# Altium project Fio4.PrjPcb
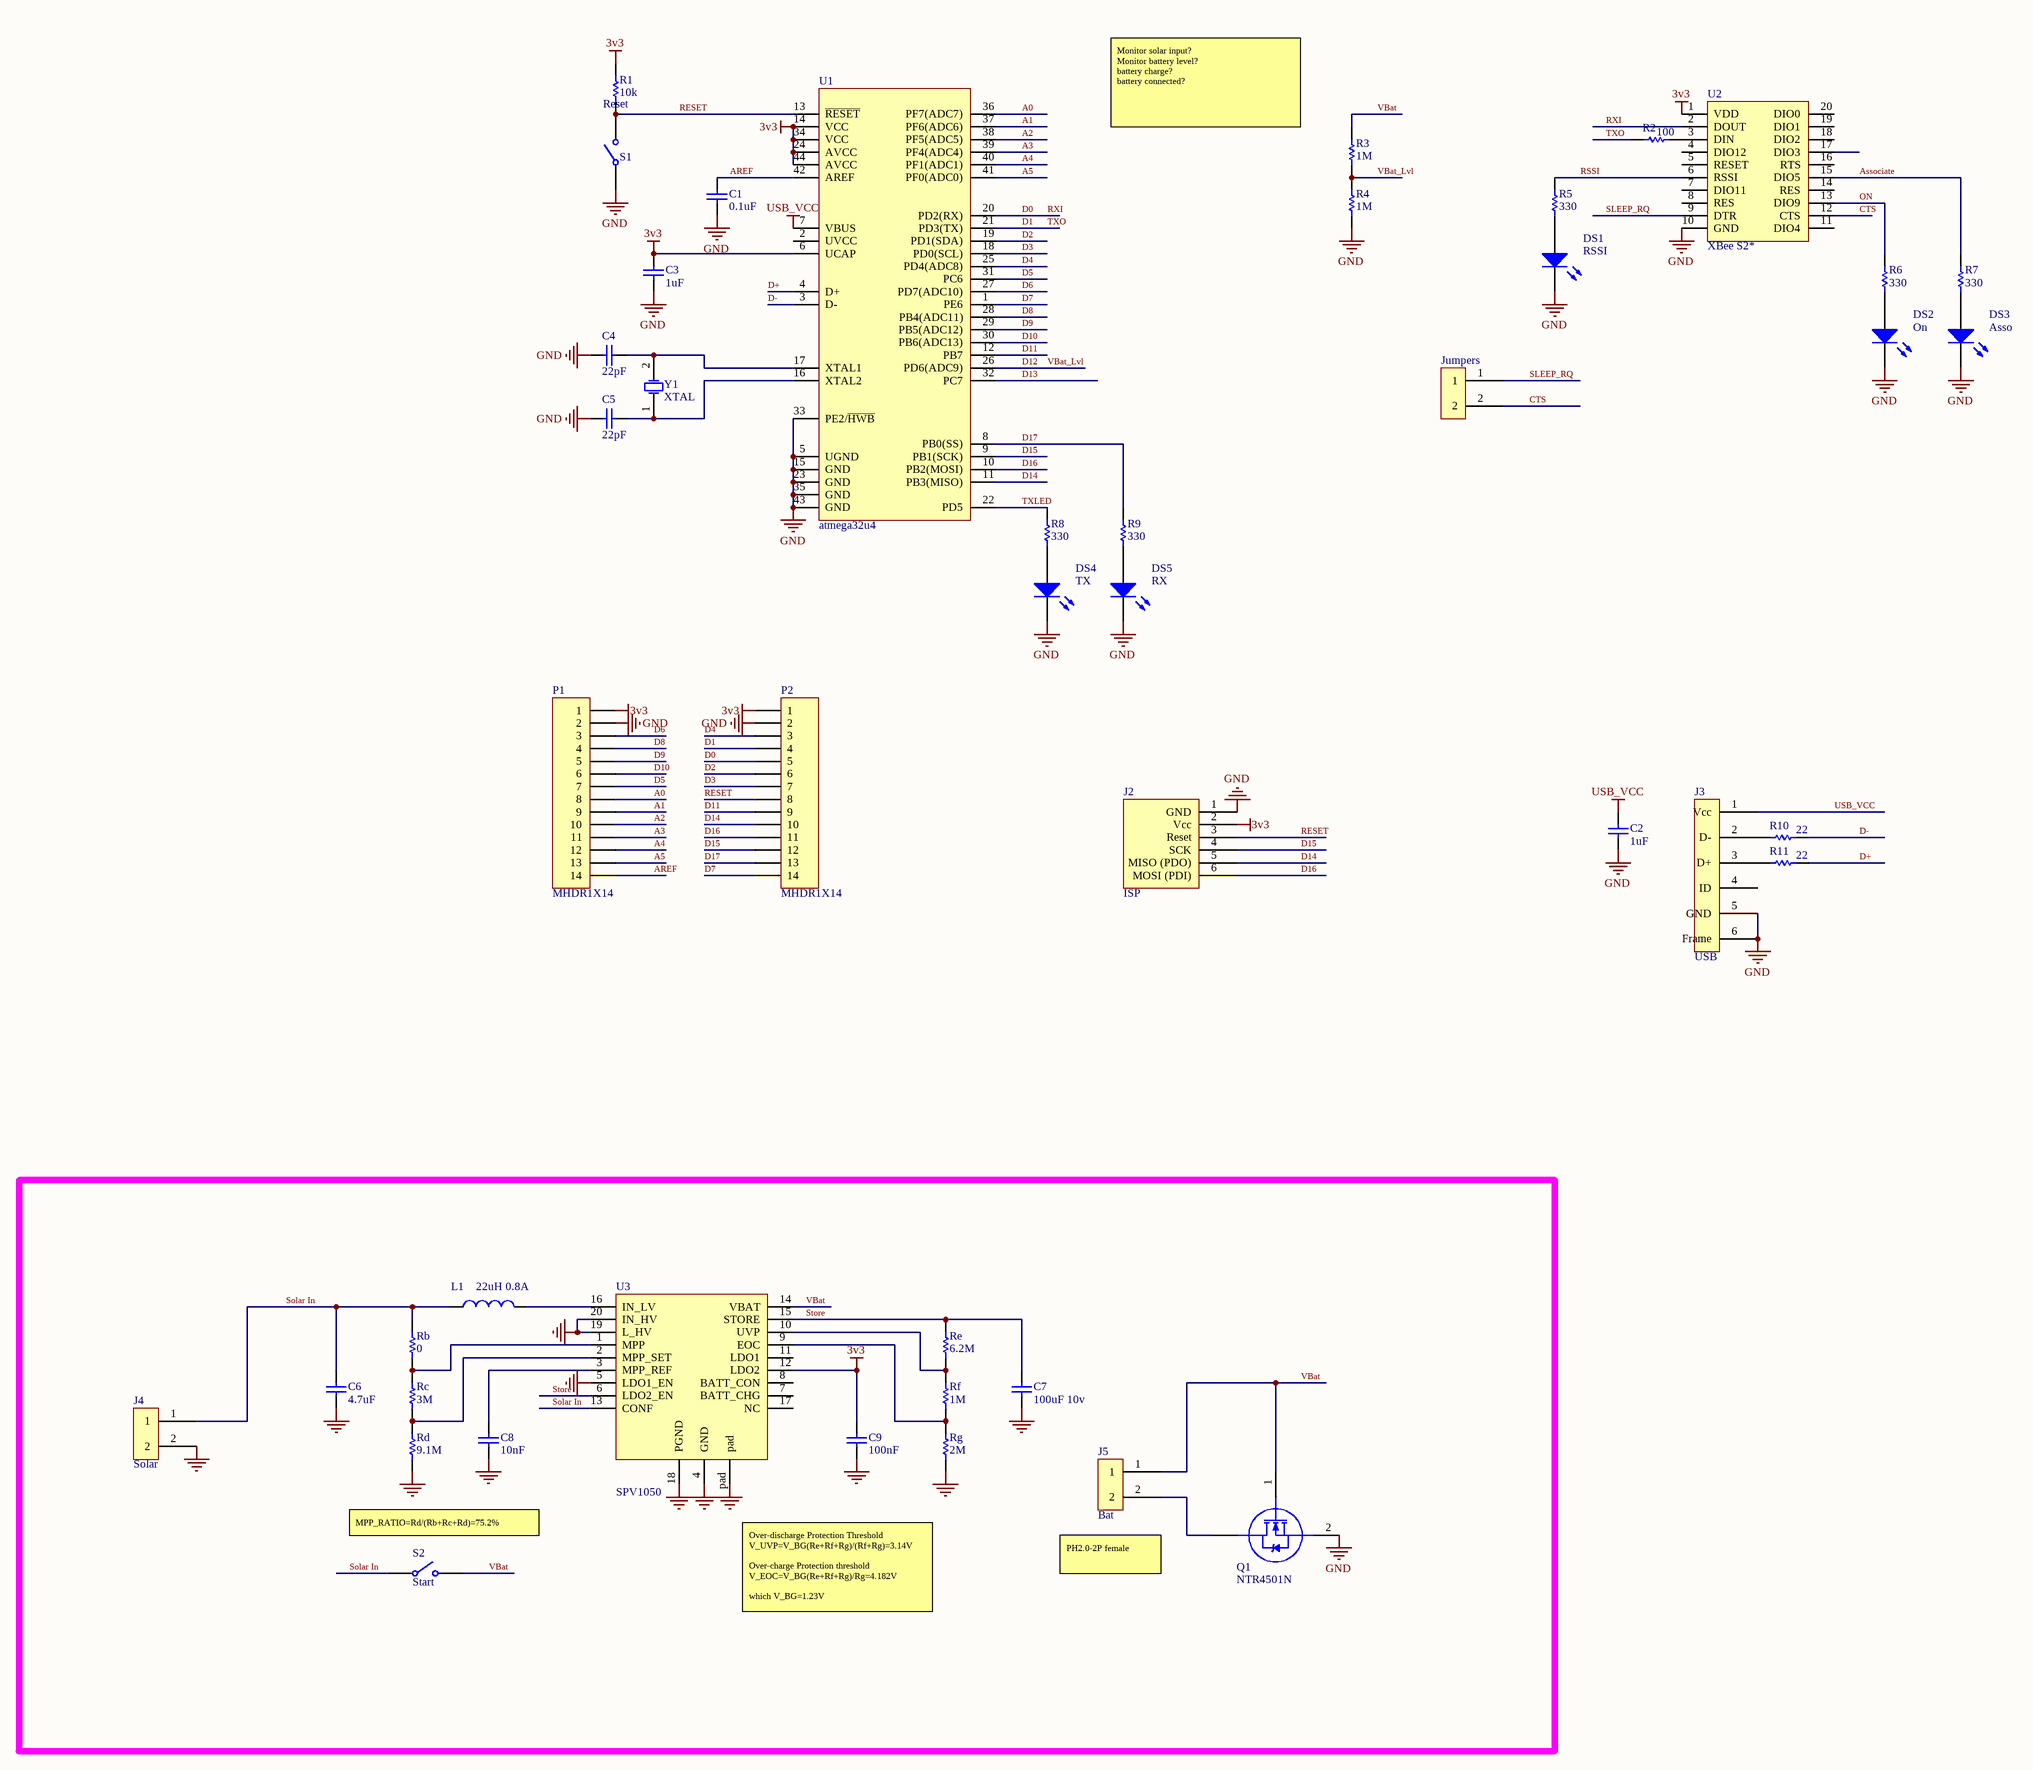
[diagram p0: Fio4.SchDoc]
1 sheet, 46 parts. Net scope: global (net labels, ports and power ports of the same name join across sheets).

## Sheet Fio4.SchDoc
size A1

### Parts
C1  value 0.1uF  [Cap SMD 0603]  (hidden comment: Cap)
C2  value 1uF  [Cap SMD 0805A]  (hidden comment: Cap)
C3  value 1uF  [Cap SMD 0603]  (hidden comment: Cap)
C4  value 22pF  [Cap SMD 0603]  (hidden comment: Cap)
C5  value 22pF  [Cap SMD 0603]  (hidden comment: Cap)
C6  value 4.7uF  [Cap SMD 0805A]  (hidden comment: Cap)
C7  value 100uF 10v  [Cap SMD 0805A]  (hidden comment: Cap)
C8  value 10nF  [Cap SMD 0603]  (hidden comment: Cap)
C9  value 100nF  [Cap SMD 0603]  (hidden comment: Cap)
DS1  RSSI  [LED SMD 0603]
DS2  On  [LED SMD 0603]
DS3  Asso  [LED SMD 0603]
DS4  TX  [LED SMD 0603]
DS5  RX  [LED SMD 0603]
J2  ISP  [HDR2x3]
J3  USB  [USB mini]
J4  Solar  [0.1 SIP 2 PIN]
J5  Bat  [0.1 SIP 2 PIN]
Jumpers  SIP2 CONNECTOR  [HDR2]  (value not drawn)
L1  value 22uH 0.8A  [Inductor SMD CoilCraft LPS4018]  (hidden comment: Inductor)
P1  MHDR1X14  [HDR14]
P2  MHDR1X14  [HDR14]
Q1  NTR4501N  [SO-G3]
R1  value 10k  [Res SMD 0603]  (hidden comment: Res1)
R2  value 100  [Res SMD 0603]  (hidden comment: Res1)
R3  value 1M  [Res SMD 0603]  (hidden comment: Res1)
R4  value 1M  [Res SMD 0603]  (hidden comment: Res1)
R5  value 330  [Res SMD 0603]  (hidden comment: Res1)
R6  value 330  [Res SMD 0603]  (hidden comment: Res1)
R7  value 330  [Res SMD 0603]  (hidden comment: Res1)
R8  value 330  [Res SMD 0603]  (hidden comment: Res1)
R9  value 330  [Res SMD 0603]  (hidden comment: Res1)
R10  value 22  [Res SMD 0805A]  (hidden comment: Res1)
R11  value 22  [Res SMD 0805A]  (hidden comment: Res1)
Rb  value 0  [Res SMD 0603]  (hidden comment: Res1)
Rc  value 3M  [Res SMD 0603]  (hidden comment: Res1)
Rd  value 9.1M  [Res SMD 0603]  (hidden comment: Res1)
Re  value 6.2M  [Res SMD 0603]  (hidden comment: Res1)
Rf  value 1M  [Res SMD 0603]  (hidden comment: Res1)
Rg  value 2M  [Res SMD 0603]  (hidden comment: Res1)
S1  Reset  [SPST Tactile 6x3.5]
S2  Start  [SPST Tactile 6x3.5]
U1  atmega32u4  [TQFP 44]
U2  XBee S2*  [XBee S2C]
U3  SPV1050
Y1  XTAL  [Crystal TXC SMD]

### Nets
3v3: C3.2 C9.2 J2.2(Vcc) P1.1 P2.1 R1.2 U1.6(UCAP) U1.14(VCC) U1.24(AVCC) U1.34(VCC) U1.44(AVCC) U2.1(VDD) U3.12(LDO2)
GND: C1.1 C2.1 C3.1 C4.2 C5.2 C6.1 C7.1 C8.1 C9.1 DS1.K DS2.K DS3.K DS4.K DS5.K J2.1(GND) J3.5(GND) J3.6(Frame) J4.2 P1.2 P2.2 Q1.2(S) R4.1 Rd.1 Rg.1 S1.1 U1.5(UGND) U1.15(GND) U1.23(GND) U1.33(PE2/~{HWB}) U1.35(GND) U1.43(GND) U2.10(GND) U3.4(GND) U3.5(LDO1_EN) U3.18(PGND) U3.19(L_HV) U3.20(IN_HV) U3.pad
USB_VCC: C2.2 J3.1(Vcc) U1.7(VBUS)
A0: P1.8 U1.36(PF7(ADC7))
A1: P1.9 U1.37(PF6(ADC6))
A2: P1.10 U1.38(PF5(ADC5))
A3: P1.11 U1.39(PF4(ADC4))
A4: P1.12 U1.40(PF1(ADC1))
A5: P1.13 U1.41(PF0(ADC0))
AREF: C1.2 P1.14 U1.42(AREF)
Associate: R7.2 U2.15(DIO5)
CTS: Jumpers.2 U2.12(CTS)
D0: P2.5 U1.20(PD2(RX)) U2.2(DOUT)  [also labelled RXI]
D1: P2.4 R2.2 U1.21(PD3(TX))  [also labelled TXO]
D2: P2.6 U1.19(PD1(SDA))
D3: P2.7 U1.18(PD0(SCL))
D4: P2.3 U1.25(PD4(ADC8))
D5: P1.7 U1.31(PC6)
D6: P1.3 U1.27(PD7(ADC10))
D7: P2.14 U1.1(PE6)
D8: P1.4 U1.28(PB4(ADC11))
D9: P1.5 U1.29(PB5(ADC12))
D10: P1.6 U1.30(PB6(ADC13))
D11: P2.9 U1.12(PB7)
D12: R3.1 R4.2 U1.26(PD6(ADC9))  [also labelled VBat_Lvl]
D13: U1.32(PC7)
D14: J2.5(MISO_(PDO)) P2.10 U1.11(PB3(MISO))
D15: J2.4(SCK) P2.12 U1.9(PB1(SCK))
D16: J2.6(MOSI_(PDI)) P2.11 U1.10(PB2(MOSI))
D17: P2.13 R9.2 U1.8(PB0(SS))
D+: R11.1 U1.4(D+)
D-: R10.1 U1.3(D-)
ON: R6.2 U2.13(DIO9)
RESET: J2.3(Reset) P2.8 R1.1 S1.2 U1.13(~{RESET})
RSSI: R5.2 U2.6(RSSI)
SLEEP_RQ: Jumpers.1 U2.9(DTR)
Solar In: C6.2 J4.1 L1.1 Rb.2 S2.1 U3.13(CONF)
Store: C7.2 Re.2 U3.6(LDO2_EN) U3.15(STORE)
TXLED: R8.2 U1.22(PD5)
VBat: J5.1 Q1.1(G) R3.2 S2.2 U3.14(VBAT)
NetC4_1: C4.1 U1.17(XTAL1) Y1.2(OSC2)
NetC5_1: C5.1 U1.16(XTAL2) Y1.1(OSC1)
NetC8_2: C8.2 U3.3(MPP_REF)
NetDS1_A: DS1.A R5.1
NetDS2_A: DS2.A R6.1
NetDS3_A: DS3.A R7.1
NetDS4_A: DS4.A R8.1
NetDS5_A: DS5.A R9.1
NetJ3_2: J3.2(D-) R10.2
NetJ3_3: J3.3(D+) R11.2
NetJ5_2: J5.2 Q1.3(D)
NetL1_2: L1.2 U3.16(IN_LV)
NetR2_1: R2.1 U2.3(DIN)
NetRb_1: Rb.1 Rc.2 U3.1(MPP)
NetRc_1: Rc.1 Rd.2 U3.2(MPP_SET)
NetRe_1: Re.1 Rf.2 U3.10(UVP)
NetRf_1: Rf.1 Rg.2 U3.9(EOC)

Not connected (* = marked no-connect by the designer): J3 4(ID); U1 2(UVCC); U2 4(DIO12) 5(RESET) 7(DIO11) 8(RES) 11(DIO4) 14(RES) 16(RTS) 17(DIO3) 18(DIO2) 19(DIO1) 20(DIO0); U3 7(BATT_CHG) 8(BATT_CON) 11(LDO1) 17(NC)

### Notes on the sheet
- Monitor solar input?
  Monitor battery level?
  battery charge?
  battery connected?
- MPP_RATIO=Rd/(Rb+Rc+Rd)=75.2%
- Over-discharge Protection Threshold
  V_UVP=V_BG(Re+Rf+Rg)/(Rf+Rg)=3.14V
  Over-charge Protection threshold
  V_EOC=V_BG(Re+Rf+Rg)/Rg=4.182V
  which V_BG=1.23V
- (near J5) PH2.0-2P female

### Library data of the parts
C1-C9 = Cap: Capacitor; Published: 8-Jun-2000; LatestRevisionDate: 17-Jul-2002; LatestRevisionNote: Re-released for DXP Platform.; PackageReference: RAD-0.3; Publisher: Altium Limited; PackageDescription: Radial Cap, Thru-Hole; 2 Leads; 0.3 in Pin Spacing
DS1-DS5 = LED: RGB LED Common Anode; Published: 8-Jun-2000; Revision: July-2002: Re-released for DXP Platform.; Publisher: Altium Limited
J2 = ISP Connector: pin to pad: 1>6 3>5 4>3 5>1 6>4
J3 = SIP6 CONNECTOR
J4 J5 = SIP2 CONNECTOR
L1 = Inductor: Code_IEC: 1005; Published: 8-Jun-2000; LatestRevisionDate: 29-May-2009; LatestRevisionNote: IPC-7351 Footprint Added.; PackageReference: 0402-A; Publisher: Altium Limited; PackageDescription: Chip Inductor; Code_JEITA: 0402
P1 P2 = MHDR1X14: Header, 14-Pin; LatestRevisionDate: 17-Jul-2002; LatestRevisionNote: Re-released for DXP Platform.; Publisher: Altium Limited
Q1 = NTR4501N: HEXFET Power MOSFET; Revision 1: 29-Sep-2000: Re-orientated a 'Drain' pin on first part.; Revision 2: 17-Jul-2002: Re-released for DXP Platform.; Package Information: Latest Revision: Feb-2001; Code - JEDEC: MS-012-AA; Published: 8-Jun-2000; Datasheet: Latest Revision: Dec-1997; Package Reference: SO-8; Publisher: Altium Limited
R1-R11 Rb Rc Rd Re Rf Rg = Resistor
S1 S2 = SW-PB-SPST: Push Button, Single-Pole, Single-Throw; Published: 24-Mar-1999; Revision: July-2002: Re-released for DXP Platform.; Publisher: Altium Limited
U2 = XBEE S2
U3 = SPV1050 Engery Harvester and Charger
Y1 = XTAL: Crystal Oscillator; Published: 8-Jun-2000; LatestRevisionDate: 17-Jul-2002; LatestRevisionNote: Re-released for DXP Platform.; PackageReference: R38; Publisher: Altium Limited; PackageDescription: Crystal, Thru-Hole; 2 Leads; Body 3.1 x 8.2 mm (Dia.xH)